# Altium schematic sheet SMPS_Section.SchDoc (part 1 of 2)
size A4
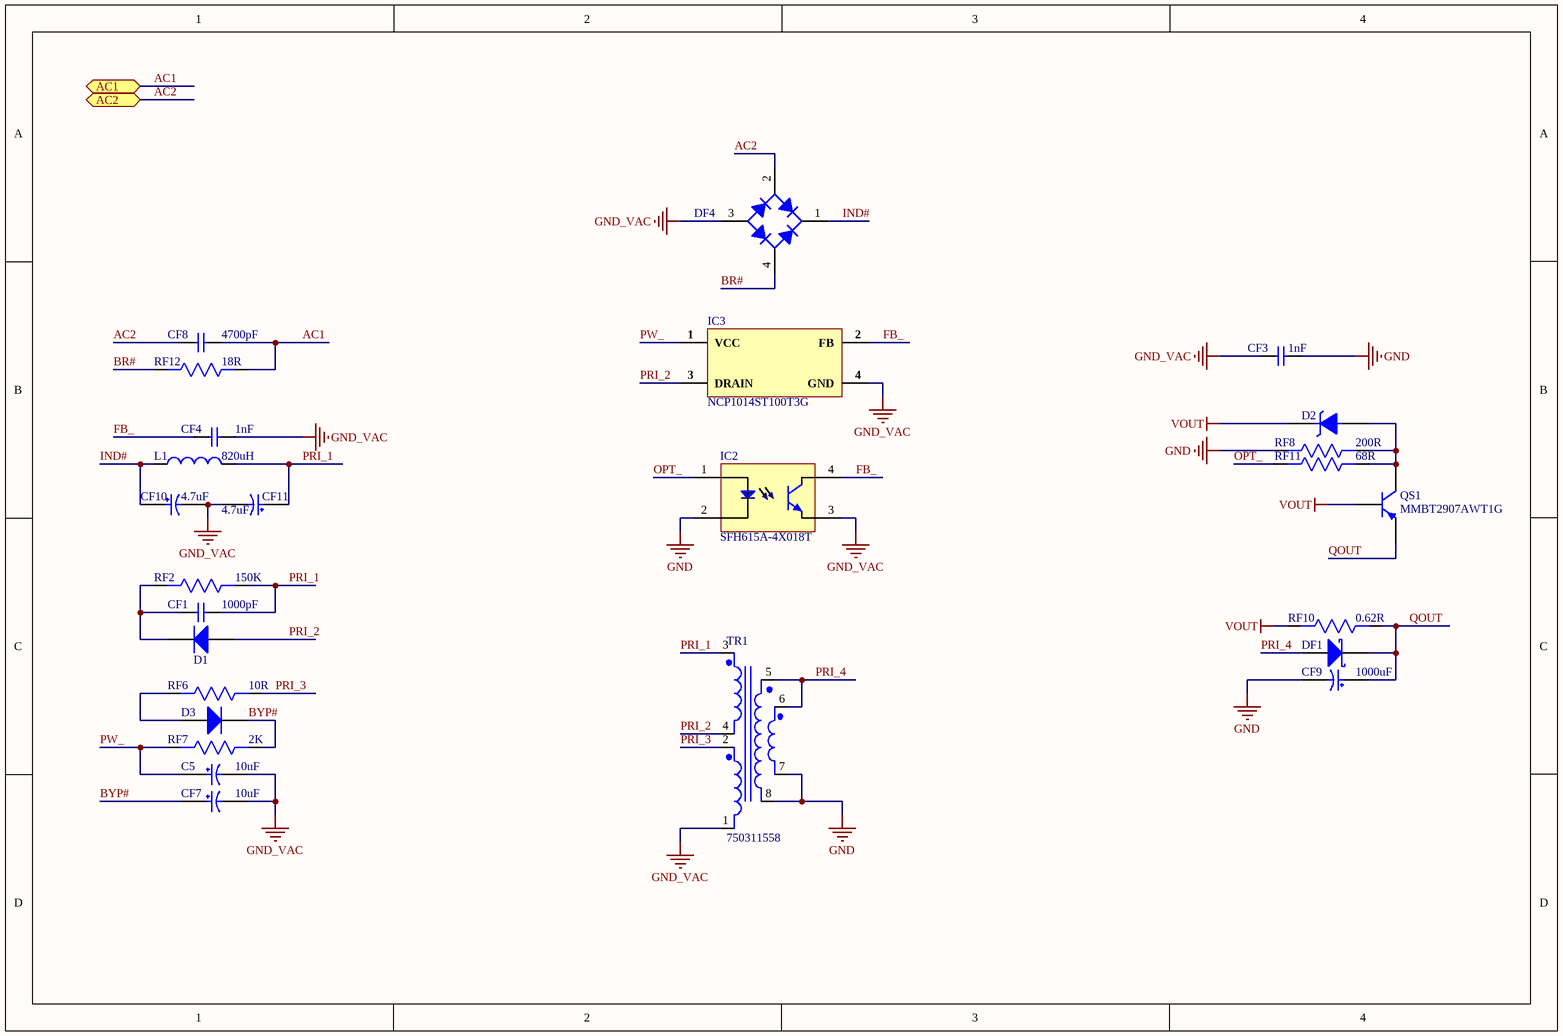
[diagram p0: SMPS_Section.SchDoc]

## Parts
C5  10uF  [EEE-1EA100WR]
CF1  1000pF  [Cap0603]
CF3  1nF  [RAD-0.4]
CF4  1nF  [Cap0402]
CF7  10uF  [EEE-1EA100WR]
CF8  4700pF  [CAP-2220]
CF9  1000uF  [UWT0J102MNL1GS]
CF10  4.7uF  [ULR2G4R7MNL1GS]
CF11  4.7uF  [ULR2G4R7MNL1GS]
D1  MURS160T3G  [SMB]  (value not drawn)
D2  MMSZ5229BT1  [SOD-123]  (value not drawn)
D3  MMSD4148T1G  [SOD-123]  (value not drawn)
DF1  MBRS360T3G  [SMC]  (value not drawn)
DF4  DF04S-T  [DF04S-T]  (value not drawn)
IC2  SFH615A-4X018T  [SFH615A-4X018T]
IC3  NCP1014ST100T3G  [SOT-223]
L1  820uH  [DR74-821-R]
QS1  MMBT2907AWT1G  [SC-70-3 (SOT323)]
RF2  150K  [Res0603]
RF6  10R  [Res0402]
RF7  2K  [Res0402]
RF8  200R  [Res0402]
RF10  0.62R  [RES 2512]
RF11  68R  [Res0402]
RF12  18R  [RES 2512]
TR1  750311558  [750311558]

## Ports
AC1 (bidir), AC2 (bidir)

## Nets
GND: CF3.2 CF9.2 IC2.2(CATHODE) RF8.2 TR1.7 TR1.8
GND_VAC: C5.2 CF3.1 CF4.2 CF7.2 CF10.2 CF11.2 DF4.3(-) IC2.3(E) IC3.4(GND) TR1.1
VOUT: D2.2(CATHODE) QS1.1(B) RF10.2
AC1: CF8.2 RF12.1 ; port AC1
AC2: CF8.1 DF4.2(-) ; port AC2
BR#: DF4.4 RF12.2
BYP#: CF7.1 D3.2(K) RF7.1
FB_: CF4.1 IC2.4(C) IC3.2(FB)
IND#: CF10.1 DF4.1(+) L1.1
OPT_: IC2.1(Anode) RF11.2
PRI_1: CF1.2 CF11.1 L1.2 RF2.1 TR1.3
PRI_2: D1.1(A) IC3.3(DRAIN) TR1.4
PRI_3: RF6.1 TR1.2
PRI_4: DF1.1(A) TR1.5 TR1.6
PW_: C5.1 IC3.1(VCC) RF7.2
QOUT: CF9.1 DF1.2(K) QS1.2(E) RF10.1
NetCF1_1: CF1.1 D1.2(K) RF2.2
NetD2_1: D2.1(ANODE) QS1.3(C) RF8.1 RF11.1
NetD3_1: D3.1(A) RF6.2